# Altium schematic sheet GPIO.SchDoc
size A
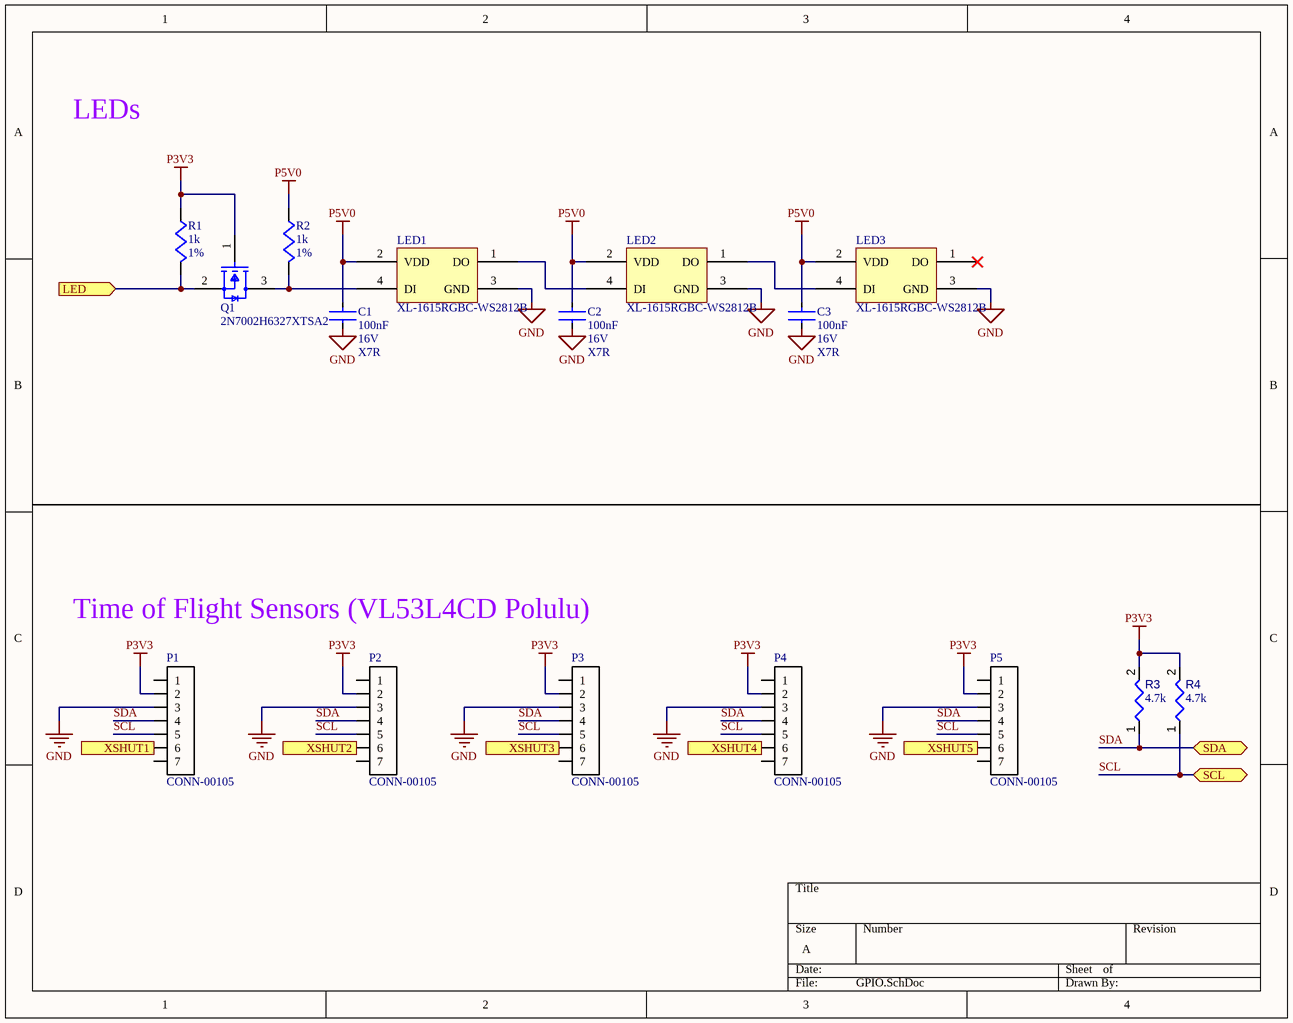
[diagram p0: GPIO.SchDoc]

## Parts
C1  value 100nF  Voltage: 16V  Dielectric: X7R  [C0402]  (hidden comment: 100n 16V X7R 0402)
C2  value 100nF  Voltage: 16V  Dielectric: X7R  [C0402]  (hidden comment: 100n 16V X7R 0402)
C3  value 100nF  Voltage: 16V  Dielectric: X7R  [C0402]  (hidden comment: 100n 16V X7R 0402)
LED1  XL-1615RGBC-WS2812B  [XL-1615RGBC-WS2812B-Footprint-1]
LED2  XL-1615RGBC-WS2812B  [XL-1615RGBC-WS2812B-Footprint-1]
LED3  XL-1615RGBC-WS2812B  [XL-1615RGBC-WS2812B-Footprint-1]
P1  CONN-00105  [HDDR_7x1_0]
P2  CONN-00105  [HDDR_7x1_0]
P3  CONN-00105  [HDDR_7x1_0]
P4  CONN-00105  [HDDR_7x1_0]
P5  CONN-00105  [HDDR_7x1_0]
Q1  2N7002H6327XTSA2  [FP-PG-SOT23-3-MFG]
R1  value 1k  Tolerance: 1%  [R0402]  (hidden comment: 1k 1% 0402)
R2  value 1k  Tolerance: 1%  [R0402]  (hidden comment: 1k 1% 0402)
R3  value 4.7k  [RESC2013X70X40ML20T20]  (hidden comment: Resistor 4k7 +/-1% 0805 125 mW)
R4  value 4.7k  [RESC2013X70X40ML20T20]  (hidden comment: Resistor 4k7 +/-1% 0805 125 mW)

## Ports
LED (in), SCL (bidir), SDA (bidir), XSHUT1 (in), XSHUT2 (in), XSHUT3 (in), XSHUT4 (in), XSHUT5 (in)

## Nets
GND: C1.2 C2.2 C3.2 LED1.3(GND) LED2.3(GND) LED3.3(GND) P1.3 P2.3 P3.3 P4.3 P5.3
P3V3: P1.2 P2.2 P3.2 P4.2 P5.2 Q1.1(gate) R1.1 R3.2 R4.2
P5V0: C1.1 C2.1 C3.1 LED1.2(VDD) LED2.2(VDD) LED3.2(VDD) R2.1
LED: Q1.2(source) R1.2 ; port LED
SCL: P1.5 P2.5 P3.5 P4.5 P5.5 R4.1 ; port SCL
SDA: P1.4 P2.4 P3.4 P4.4 P5.4 R3.1 ; port SDA
XSHUT1: P1.6 ; port XSHUT1
XSHUT2: P2.6 ; port XSHUT2
XSHUT3: P3.6 ; port XSHUT3
XSHUT4: P4.6 ; port XSHUT4
XSHUT5: P5.6 ; port XSHUT5
NetLED1_1: LED1.1(DO) LED2.4(DI)
NetLED1_4: LED1.4(DI) Q1.3(drain) R2.2
NetLED2_1: LED2.1(DO) LED3.4(DI)

Not connected (* = marked no-connect by the designer): LED3 1(DO)*; P1 1 7; P2 1 7; P3 1 7; P4 1 7; P5 1 7

## Notes on the sheet
- LEDs
- Time of Flight Sensors (VL53L4CD Polulu)

## Library data of the parts
C1-C3 = CMP-001-00088-6: 100nF 16V X7R ±10% 0402 Multilayer Ceramic Capacitors MLCC - SMD/SMT ROHS; LCSC Part #: C1525; Package: 0402
LED1-LED3 = CMP-007-00038-3: 1615  RGB LEDs(Built-in IC) ROHS; LED Type: Addressable; LCSC Part #: C5349954; Package: SMD-4P,1.6x1.5mm
P1-P5 = CMP-019-000100-1: Header, 7x1, 0.1"; Manufacturer: Samtec; Manufacturer PN: TSW-107-07-F-S; Positions per level: 7; Levels: 1; Type: Header; Cost: 0.61; Part Number: CONN-00105; Pin Count: 7; Component Type: Standard; Design Item ID: CONN-00105; Source: Connectors$.SchLib
Q1 = CMP-32901-000180-1: MOSFET N-CH 60V 0.3A SOT23; Rise Time: 3.3ns; Input Capacitance: 20pF; Rds On Max: 3R; Gate to Source Voltage (Vgs): 20V; Continuous Drain Current (ID): 300mA; Max Power Dissipation: 500mW; Packaging: Tape and Reel; Mount: Surface Mount; Case/Package: SOT-23; Drain to Source Voltage (Vdss): 60V; Min Operating Temperature: -55°C; Halogen Free: Halogen Free; Max Dual Supply Voltage: 60V; Number of Pins: 3; Lead Free: Lead Free; Max Operating Temperature: 150°C
R1 R2 = CMP-009-00189-3: 62.5mW Thick Film Resistors 50V ±100ppm/℃ ±1% 1kΩ 0402 Chip Resistor - Surface Mount ROHS; LCSC Part #: C106235; Package: 0402
R3 R4 = CMP-009-00032-4: Chip Resistor, 4.7 KOhm, +/- 1%, 0.125 W, -55 to 155 degC, 0805 (2012 Metric); Power: 125mW; Voltage Rating: 150V; RoHS Compliant: True; Tolerance: 1%; Case/Package: 0805; Pins: 2; Max Operating Temperature: 155°C; Mounting Technology: SM; Min Operating Temperature: -55°C